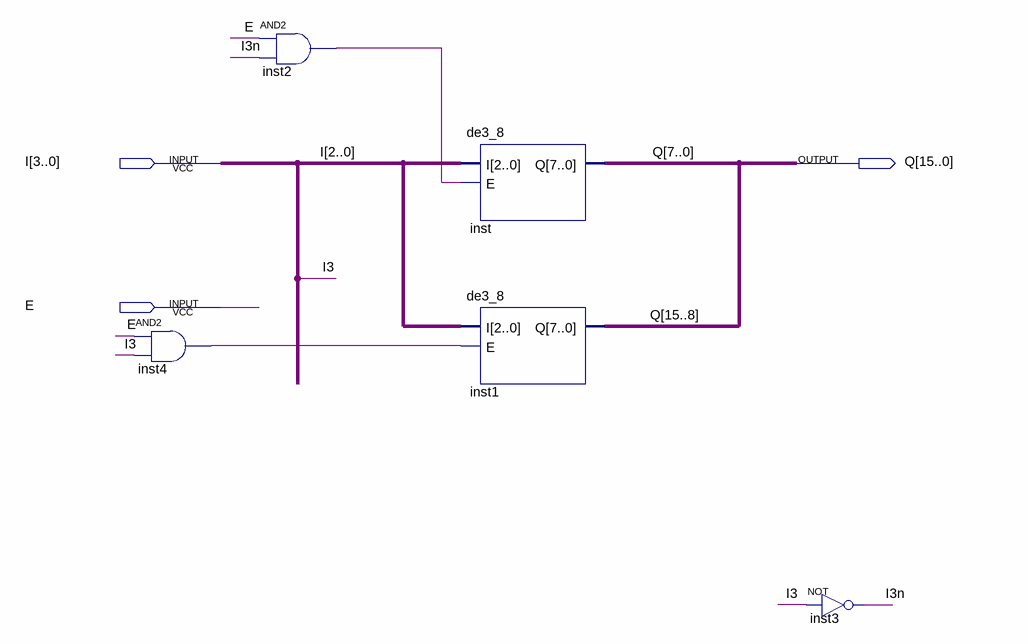
[diagram p0: schematic sheet]
// Quartus schematic de4_16.bdf as structural Verilog: 5 symbols, 3 pins
module de4_16 (
  input  [3:0] I,
  input  E,
  output [15:0] Q
);

  wire I3n, inst2_out, inst4_out;

  and inst4 (inst4_out, E, I[3]);
  and inst2 (inst2_out, E, I3n);
  de3_8 inst (.I(I[2:0]), .E(inst2_out), .Q(Q[7:0]));
  de3_8 inst1 (.I(I[2:0]), .E(inst4_out), .Q(Q[15:8]));
  not inst3 (I3n, I[3]);
endmodule
